# EAGLE design Freq-counter (EAGLE 9.6.2)
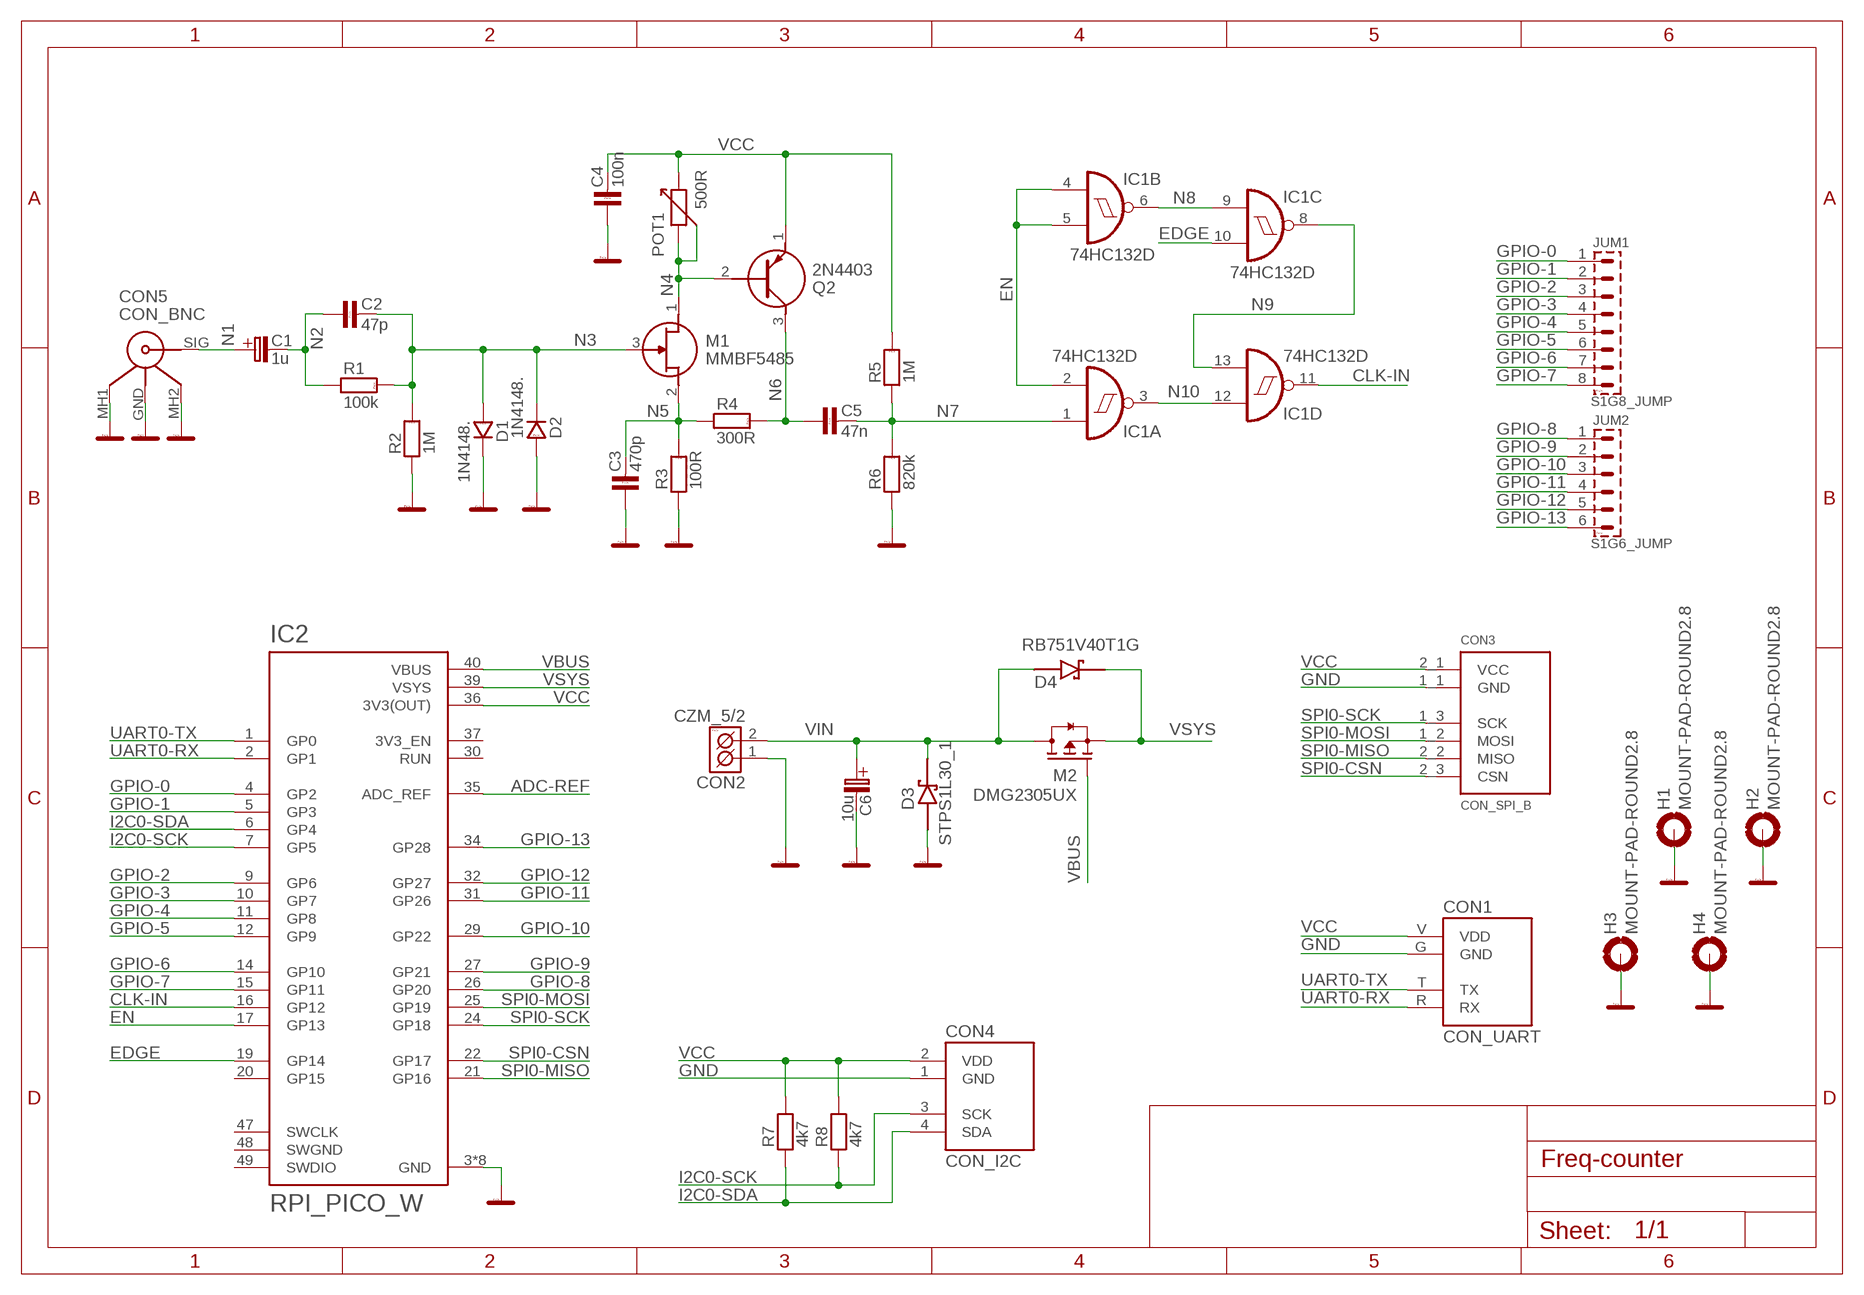
[diagram p0: schematic, sheet 1]

## Parts
C1  1u  C_EL_SMDB  [C_EL-SMD_B]
C2  47p  C-KER_0805  [0805]
C3  470p  C-KER_0805  [0805]
C4  100n  C-KER_0805  [0805]
C5  47n  C-KER_0805  [0805]
C6  10u  C_EL_SMDD  [C_EL-SMD_D]
CON1  CON_UART  [UART_CONN]
CON2  CZM_5/2  [CZM_5/2]
CON3  CON_SPI_B  [SPI_CONN_2]
CON4  CON_I2C  [I2C_CONN]
CON5  CON_BNC  [CPBNCPC010]
D1  1N4148.  [SOD-80]
D2  1N4148.  [SOD-80]
D3  STPS1L30_1  [SMA]
D4  RB751V40T1G  [SOD323]
H1  MOUNT-PAD-ROUND2.8  [2,8-PAD]
H2  MOUNT-PAD-ROUND2.8  [2,8-PAD]
H3  MOUNT-PAD-ROUND2.8  [2,8-PAD]
H4  MOUNT-PAD-ROUND2.8  [2,8-PAD]
IC1  74HC132D  [SO14]
IC2  RPI_PICO_W  RASPBERRY_PICO_W_2  [RPI_PICO_W]
JUM1  S1G8_JUMP  [S1G8_JUM]
JUM2  S1G6_JUMP  [S1G6_JUM]
M1  MMBF5485  [SOT96P237X111-3N]
M2  DMG2305UX  YJL2301D  [TRANSISTOR-FET_SOT23]
POT1  500R  POTENTIOMETER_1  [POT]
Q2  2N4403  [CS_TO-92]
R1  100k  R_0805  [0805]
R2  1M  R_0805  [0805]
R3  100R  R_0805  [0805]
R4  300R  R_0805  [0805]
R5  1M  R_0805  [0805]
R6  820k  R_0805  [0805]
R7  4k7  R_0805  [0805]
R8  4k7  R_0805  [0805]

## Nets
ADC-REF: IC2.35(ADC_REF)
CLK-IN: IC1.11(D:O) IC2.16(GP12)
EDGE: IC1.10(C:I1) IC2.19(GP14)
EN: IC1.2(A:I1) IC1.4(B:I0) IC1.5(B:I1) IC2.17(GP13)
GND: C3.1 C4.1 C6.-(C_EL-) CON1.G(GND) CON2.1(K1) CON3.1_1(GND) CON4.1(GND) CON5.MH1 CON5.MH2 D1.K D2.A D3.2(A) H1.B2,8(MOUNT) H2.B2,8(MOUNT) H3.B2,8(MOUNT) H4.B2,8(MOUNT) IC2.3(GND) IC2.8(GND) IC2.13(GND) IC2.18(GND) IC2.23(GND) IC2.28(GND) IC2.33(GND) IC2.38(GND) R2.1 R3.1 R6.1
GPIO-0: IC2.4(GP2) JUM1.1
GPIO-1: IC2.5(GP3) JUM1.2
GPIO-2: IC2.9(GP6) JUM1.3
GPIO-3: IC2.10(GP7) JUM1.4
GPIO-4: IC2.11(GP8) JUM1.5
GPIO-5: IC2.12(GP9) JUM1.6
GPIO-6: IC2.14(GP10) JUM1.7
GPIO-7: IC2.15(GP11) JUM1.8
GPIO-8: IC2.26(GP20) JUM2.1
GPIO-9: IC2.27(GP21) JUM2.2
GPIO-10: IC2.29(GP22) JUM2.3
GPIO-11: IC2.31(GP26) JUM2.4
GPIO-12: IC2.32(GP27) JUM2.5
GPIO-13: IC2.34(GP28) JUM2.6
I2C0-SCK: CON4.3(SCK) IC2.7(GP5) R8.1
I2C0-SDA: CON4.4(SDA) IC2.6(GP4) R7.1
N1: C1.+(C_EL+) CON5.SIG
N2: C1.-(C_EL-) C2.1 R1.1
N3: C2.2 D1.A D2.K M1.3(G) R1.2 R2.2
N4: M1.1(D) POT1.1 POT1.2 Q2.2(B)
N5: C3.2 M1.2(S) R3.2 R4.1
N6: C5.1 Q2.3(C) R4.2
N7: C5.2 IC1.1(A:I0) R5.1 R6.2
N8: IC1.6(B:O) IC1.9(C:I0)
N9: IC1.8(C:O) IC1.13(D:I1)
N10: IC1.3(A:O) IC1.12(D:I0)
N$1: CON5.GND ; supply symbol labelled GND
SPI0-CSN: CON3.2_3(CSN) IC2.22(GP17)
SPI0-MISO: CON3.2_2(MISO) IC2.21(GP16)
SPI0-MOSI: CON3.1_2(MOSI) IC2.25(GP19)
SPI0-SCK: CON3.1_3(SCK) IC2.24(GP18)
UART0-RX: CON1.R(RX) IC2.2(GP1)
UART0-TX: CON1.T(TX) IC2.1(GP0)
VBUS: IC2.40(VBUS) M2.1(G)
VCC: C4.2 CON1.V(VDD) CON3.2_1(VCC) CON4.2(VDD) IC2.36(3V3(OUT)) POT1.3 Q2.1(E) R5.2 R7.2 R8.2
VIN: C6.+(C_EL+) CON2.2(K2) D3.1(C) D4.2(A) M2.3(D)
VSYS: D4.1(C) IC2.39(VSYS) M2.2(S)
Unconnected: IC2.20(GP15) IC2.30(RUN) IC2.37(3V3_EN) IC2.47(SWCLK) IC2.49(SWDIO)

## Power pins joined to a net without a drawn wire
GND: IC1.7(P:GND)
SWGND: IC2.48(SWGND)
VCC: IC1.14(P:VCC)

## Library data of the parts
C1 C6 = #_NG_knihovna:C_EL_SMD
C2-C5 = #PaJa_31:C-KER: Kondenzator - keramicky
CON1 = #_NG_knihovna:CON_UART
CON2 = #PaJa_konektory:CZM_5/2: Svorkovnice - roztec 5,08mm - dvojita 13,5A/250V
CON3 = #_NG_knihovna:CON_SPI
CON4 = #_NG_knihovna:CON_I2C
CON5 = #_NG_knihovna:CON_BNC: RF Connectors / Coaxial Connectors BNC RA JACK 75 OHM Source: Datasheet <https://www.datasheets360.com/pdf/-7916707900000409672?query=CP-BNCPC-010&pqid=103559711>; DESCRIPTION: RF Connectors / Coaxial Connectors BNC RA JACK 75 OHM; HEIGHT: 15.8mm; MANUFACTURER_NAME: Cinch Connectivity Solutions; MANUFACTURER_PART_NUMBER: CP-BNCPC-010; MOUSER_PART_NUMBER: 530-CPBNCPC-010; MOUSER_PRICE-STOCK: https://www.mouser.co.uk/ProductDetail/AIM-Cambridge-Cinch-Connectivity-Solutions/CP-BNCPC-010?qs=atelM%2FHH1EDYnt71VcRMKg%3D%3D
D1 D2 = #PaJa_31:1N4148: Univerzalni dioda - 0,15A, 75V
D3 = #_NG_knihovna:STPS1L30
D4 = #_NG_knihovna:RB751V40T1G
H1-H4 = holes:MOUNT-PAD-ROUND: MOUNTING PAD, round
IC1 = 74xx-eu:74*132: Quad 2-input NAND schmitt trigger
IC2 = #_NG_knihovna:RASPBERRY_PICO_W_2
JUM1 = #PaJa_konektory:S1G8_JUMP: Radove konektory - koliky - 8x
JUM2 = #PaJa_konektory:S1G6_JUMP: Radove konektory - koliky - 6x
M1 = SamacSys_Parts:MMBF5485: SOT-23 Source: Datasheet <https://www.onsemi.com/pub/Collateral/MMBF5486-D.PDF>; ARROW_PART_NUMBER: MMBF5485; ARROW_PRICE-STOCK: https://www.arrow.com/en/products/mmbf5485/on-semiconductor; DESCRIPTION: SOT-23; HEIGHT: 1.11mm; MANUFACTURER_NAME: onsemi; MANUFACTURER_PART_NUMBER: MMBF5485; MOUSER_PART_NUMBER: 512-MMBF5485; MOUSER_PRICE-STOCK: https://www.mouser.com/Search/Refine.aspx?Keyword=512-MMBF5485
M2 = #_NG_knihovna:YJL2301D
POT1 = #_NG_knihovna:POTENTIOMETER
Q2 = SamacSys_Parts:2N4403: Bipolar Transistors - BJT PNP Gen Pur SS Source: Datasheet <https://www.mouser.com/ds/2/68/2n4402-46341.pdf>; DESCRIPTION: Bipolar Transistors - BJT PNP Gen Pur SS; HEIGHT: mm; MANUFACTURER_NAME: Central Semiconductor; MANUFACTURER_PART_NUMBER: 2N4403; MOUSER_PART_NUMBER: 610-2N4403; MOUSER_PRICE-STOCK: https://www.mouser.com/Search/Refine.aspx?Keyword=610-2N4403
R1-R6 = #PaJa_31:R: Rezistor
R7 R8 = #_NG_knihovna:R: Rezistor

## Net classes
0 default: clearance 0.205 mm

## Board
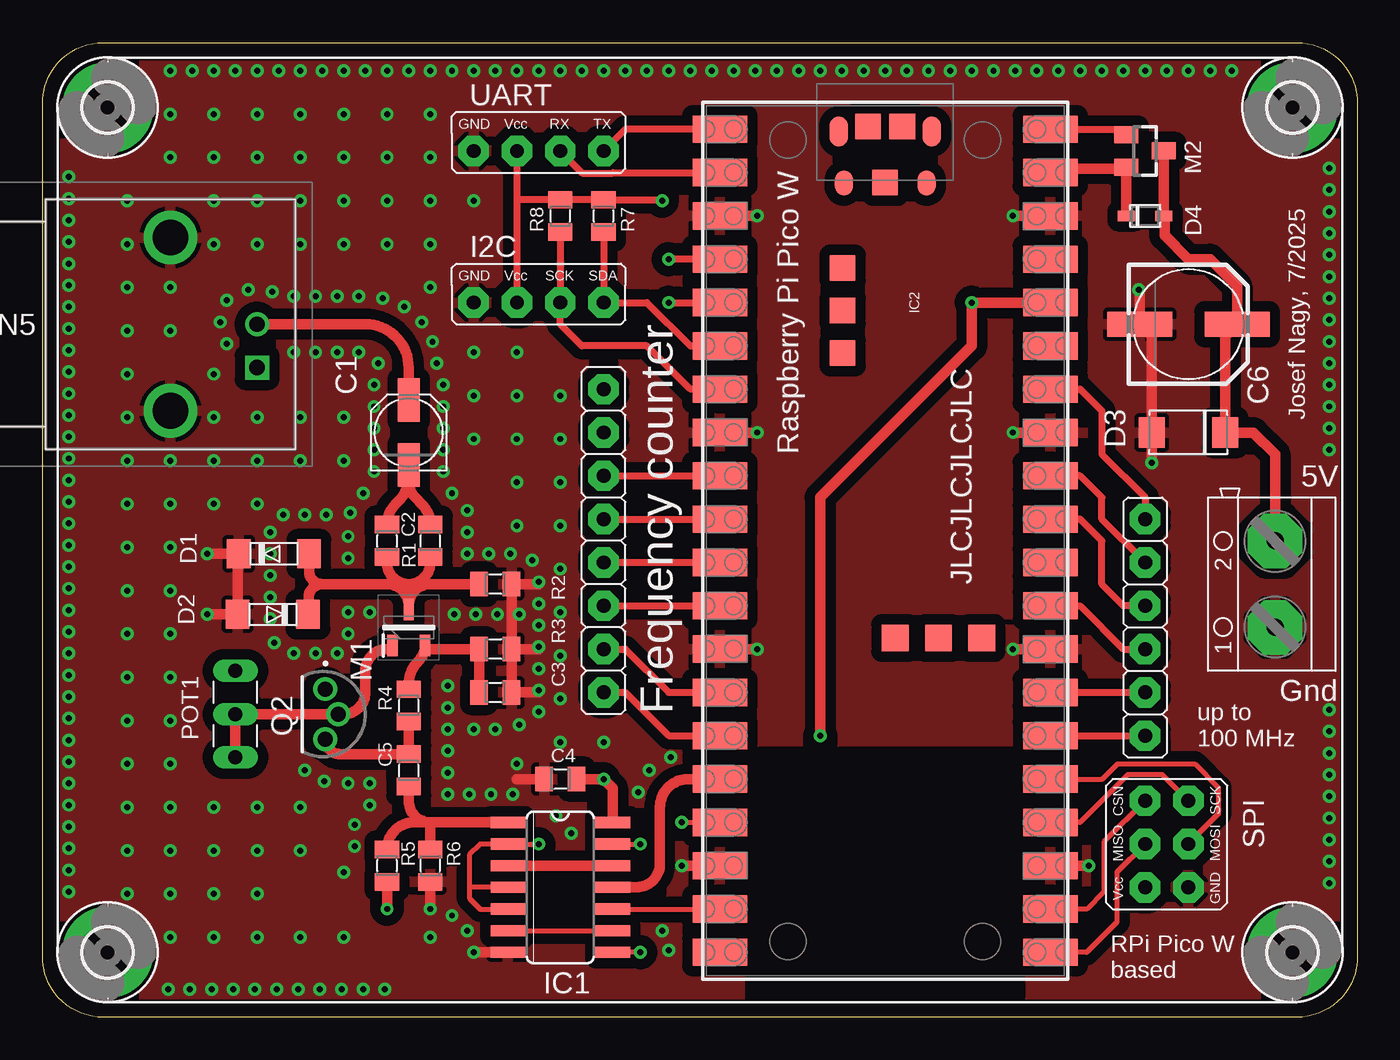
[diagram p1: board, top side]
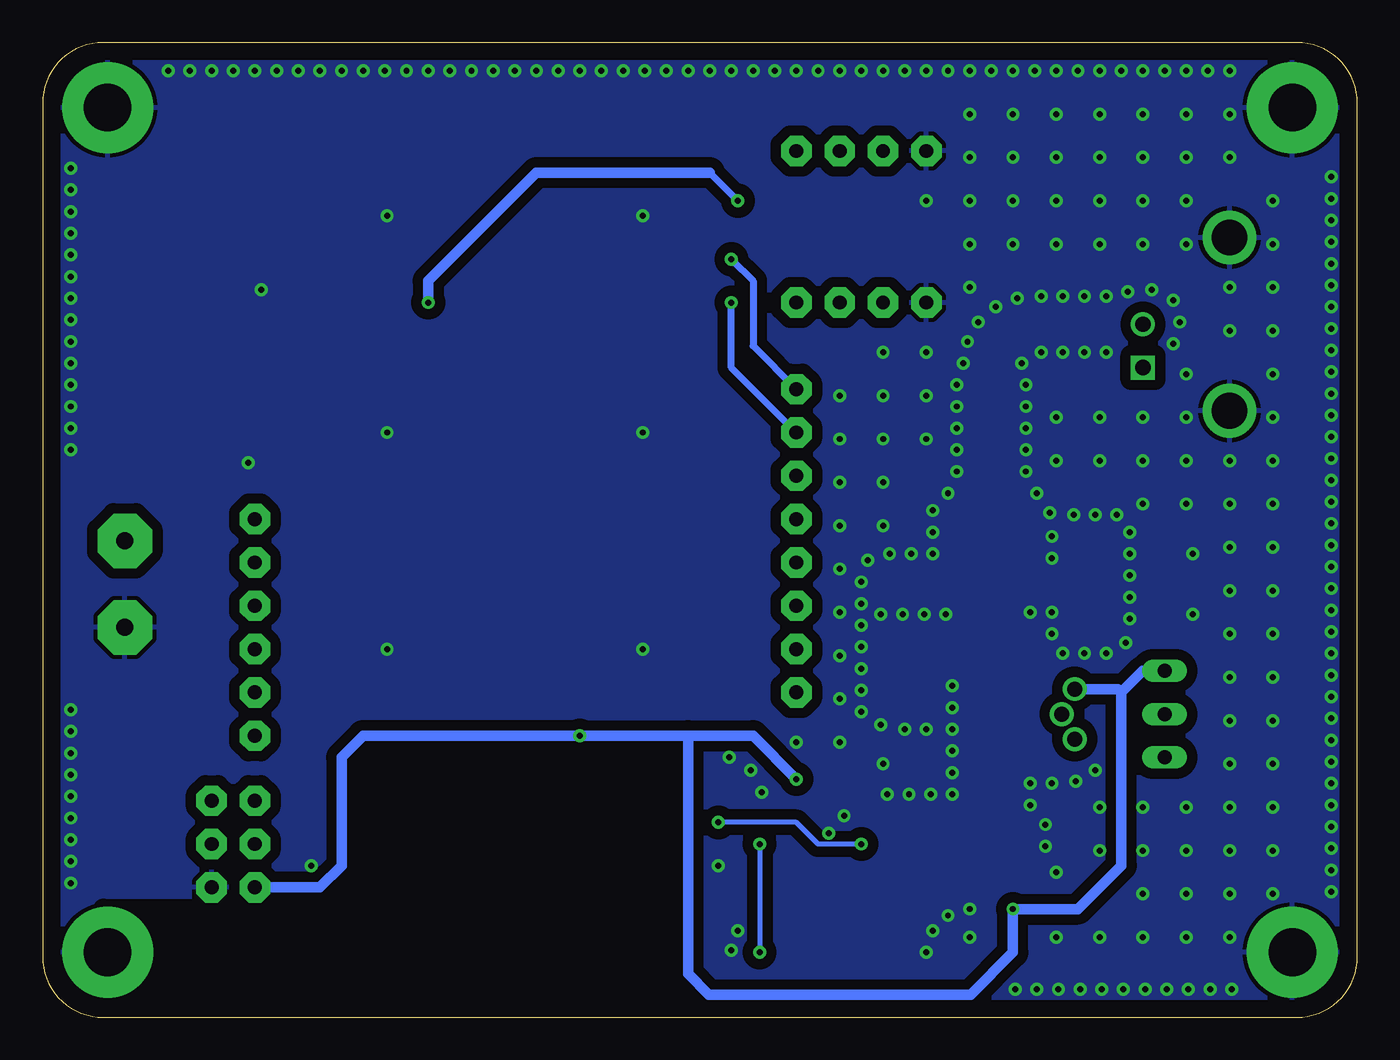
[diagram p2: board, bottom side, seen from below]

Size 77.09 x 57.15 mm. Coordinates in mm from the lower left corner, seen from the top.
Outline: 0,53.59 arc-90 3.56,57.15 73.53,57.15 arc-90 77.09,53.59 77.09,3.56 arc-90 73.53,0 3.56,0 arc-90 0,3.56 0,53.59
Copper layers (1*16): Top 0.035mm / dielectric 1.5mm / Bottom 0.035mm
Design rules "default": minimum track width 6mil, minimum drill 0.35mm, track to track 6mil, track to pad 6mil, pad to pad 6mil, via to via 6mil, smd to smd 6mil, copper to edge 40mil, drill to drill 6mil, minimum pad ring 10mil, minimum via ring 8mil, stop-mask expansion 4mil, vias tented up to drill 0mil, thermal gap 10mil
tRestrict: area 41.8,0 to 57,15.2
bRestrict: area 40.5,0 to 58.3,15.2; area 58.3,0 to 73.5,6.3
vRestrict: area 40.5,0 to 58.3,15.2; area 58.3,0 to 73.5,6.3

### Footprints (pad centres in the part's own frame; a part is rotated, then mirrored left to right if it is on the bottom)
C_EL-SMD_B = smd 2.54 x 1.27: + 1.905,0; - -1.905,0
0805 = smd 1.016 x 1.422: 1 -0.953,0; 2 0.953,0
C_EL-SMD_D = smd 3.81 x 1.473: + 2.857,0; - -2.857,0
UART_CONN = drill 0.813 pad 1.778 octagon: G -3.81,0; R 1.27,0; T 3.81,0; V -1.27,0
CZM_5/2 = drill 1 pad 3.2 octagon: 1 -2.54,0; 2 2.54,0
SPI_CONN_2 = drill 0.813 pad 1.778 octagon: 1_1 -2.54,-1.27; 1_2 0,-1.27; 1_3 2.54,-1.27; 2_1 -2.54,1.27; 2_2 0,1.27; 2_3 2.54,1.27
I2C_CONN = drill 0.813 pad 1.778 octagon: 1 -3.81,0; 2 -1.27,0; 3 1.27,0; 4 3.81,0
CPBNCPC010 = drill 0.9 pad 1.4 square: GND 0,0 | drill 2.1 pad 3.15: MH1 -5.08,-2.54; MH2 -5.08,7.62 | drill 0.9 pad 1.4: SIG 0,2.54
SOD-80 = smd 1.397 x 1.702: A 1.905,0; K -2.223,0
SMA = smd 1.524 x 1.778: 1 -2.159,0; 2 2.159,0
SOD323 = smd 1 x 0.6: 1 -1.1,0; 2 1.1,0
2,8-PAD = drill 2.8 pad 5.334: B2,8 0,0
SO14 = smd 0.66 x 2.032: 1 -3.81,-3.073; 2 -2.54,-3.073; 3 -1.27,-3.073; 4 0,-3.073; 5 1.27,-3.073; 6 2.54,-3.073; 7 3.81,-3.073; 8 3.81,3.073; 9 2.54,3.073; 10 1.27,3.073; 11 0,3.073; 12 -1.27,3.073; 13 -2.54,3.073; 14 -3.81,3.073
RPI_PICO_W = smd 3.2 x 1.6: 1 -9.69,24.13; 2 -9.69,21.59; 3 -9.69,19.05; 4 -9.69,16.51; 5 -9.69,13.97; 6 -9.69,11.43; 7 -9.69,8.89; 8 -9.69,6.35; 9 -9.69,3.81; 10 -9.69,1.27; 11 -9.69,-1.27; 12 -9.69,-3.81; 13 -9.69,-6.35; 14 -9.69,-8.89; 15 -9.69,-11.43; 16 -9.69,-13.97; 17 -9.69,-16.51; 18 -9.69,-19.05; 19 -9.69,-21.59; 20 -9.69,-24.13; 21 9.69,-24.13; 22 9.69,-21.59; 23 9.69,-19.05; 24 9.69,-16.51; 25 9.69,-13.97; 26 9.69,-11.43; 27 9.69,-8.89; 28 9.69,-6.35; 29 9.69,-3.81; 30 9.69,-1.27; 31 9.69,1.27; 32 9.69,3.81; 33 9.69,6.35; 34 9.69,8.89; 35 9.69,11.43; 36 9.69,13.97; 37 9.69,16.51; 38 9.69,19.05; 39 9.69,21.59; 40 9.69,24.13 | smd 1.5 x 1.5: 41 0,21; 42 1,24.3; 43 -1,24.3; 44 -2.5,16; 45 -2.5,13.5; 46 -2.5,11 | smd 1.575 x 1.575: 47 0.584,-5.7; 48 3.124,-5.7; 49 5.664,-5.7 | smd 1.1 x 1.8: A -2.725,24; B 2.725,24 | smd 1.05 x 1.45: C -2.425,20.97; D 2.425,20.97
S1G8_JUM = drill 0.813 pad 1.778 octagon: 1 -8.89,0; 2 -6.35,0; 3 -3.81,0; 4 -1.27,0; 5 1.27,0; 6 3.81,0; 7 6.35,0; 8 8.89,0
S1G6_JUM = drill 0.813 pad 1.778 octagon: 1 -6.35,0; 2 -3.81,0; 3 -1.27,0; 4 1.27,0; 5 3.81,0; 6 6.35,0
SOT96P237X111-3N = smd 1.25 x 0.6: 1 -1.05,0.955; 2 -1.05,-0.955; 3 1.05,0
TRANSISTOR-FET_SOT23 = smd 1 x 1.4: 1 -0.95,-1.1; 2 0.95,-1.1; 3 0,1.1
POT = drill 0.813 long: 1 -2.54,0; 2 0,0; 3 2.54,0
CS_TO-92 = drill 0.88 pad 1.35: 1 -1.47,-2.35 | drill 0.88 pad 1.4: 2 0,-1.6; 3 1.47,-2.35

### Placement (x,y rotation side)
C1  21.46,34.29 90 top
C2  20.19,27.94 270 top
C3  26.54,19.05 180 top
C4  30.35,13.97 0 top
C5  21.46,14.48 270 top
C6  67.18,40.64 0 top
CON1  29.08,50.8 0 top
CON2  72.26,25.4 90 top
CON3  65.91,10.16 90 top
CON4  29.08,41.91 0 top
CON5  12.57,38.1 0 top
D1  13.72,27.18 0 top
D2  13.34,23.62 180 top
D3  67.18,34.29 180 top
D4  64.64,46.99 0 top
H1  3.81,53.34 0 top
H2  3.81,3.81 0 top
H3  73.28,3.81 0 top
H4  73.28,53.34 0 top
IC1  30.35,7.62 270 top
IC2  49.4,27.94 0 top
JUM1  32.89,27.94 270 top
JUM2  64.64,22.86 90 top
M1  21.46,22.86 90 top
M2  64.64,50.8 270 top
POT1  11.3,17.78 90 top
Q2  18.92,17.78 270 top
R1  22.73,27.94 270 top
R2  26.54,25.4 180 top
R3  26.54,21.59 180 top
R4  21.46,18.29 270 top
R5  20.19,8.89 270 top
R6  22.73,8.89 90 top
R7  32.89,46.99 90 top
R8  30.35,46.99 90 top

### Tracks (layer width: path | path; a pad name or v marks a point on that pad's centre or on a via)
CLK-IN
  Top 0.61: IC1.11 34.8,7.62 arc90 36.2,9.02 36.2,12.32 arc-90 37.85,13.97 IC2.16
EDGE
  Top 0.305: IC1.10 IC2.19
EN  (via drill 0.35)
  Top 0.305: 25.02,7.62 25.02,9.53 25.65,10.16 IC1.2 v29.08,10.16 | 25.02,7.62 25.02,6.99 25.65,6.35 IC1.5 | IC1.4 25.02,7.62 | v37.47,11.43 IC2.17
  Bottom 0.305: v29.08,10.16 31.62,10.16 32.89,11.43 v37.47,11.43
GND  (via drill 0.35)
  Top 0.61: 64.64,40.96 C6.- | v9.65,27.18 D1.K 11.43,27.11 D2.A v9.65,23.62 | R6.1 v22.73,6.35 | IC2.3 v41.91,46.99 | IC2.8 v41.91,34.29 | IC2.13 v41.91,21.59 | IC2.18 v37.47,8.89 | IC2.33 v56.9,34.29 | v61.34,8.89 IC2.23 | v56.9,21.59 IC2.28 | v56.9,46.99 IC2.38 | R3.1 C3.1 29.08,19.05 | R3.1 R2.1 29.08,25.4 | R3.1 29.08,21.59 | C4.1 27.81,13.97 | IC1.7 v25.27,3.81 | C6.- 65.02,39.94 D3.2 v65.02,32.51 | C6.- 64.33,42.61 v64.26,42.67
  other vias: 14.73,42.29 16,42.29 17.27,42.29 18.54,42.29 14.73,38.99 16,38.99 17.27,38.99 18.54,38.99 19.69,38.35 19.94,42.16 21.21,41.66 22.23,40.77 22.86,39.62 23.11,38.35 23.5,37.08 23.5,35.81 23.5,34.54 23.5,33.27 23.5,32 24,30.73 19.43,37.08 19.43,35.81 19.43,34.54 19.43,33.27 19.43,32 18.8,30.73 18.03,29.59 17.91,28.19 17.91,26.92 16.64,29.46 15.37,29.46 14.1,29.46 17.91,23.75 19.18,23.75 17.91,22.48 17.27,21.34 16,21.34 14.73,21.34 13.59,21.97 13.34,28.45 13.34,27.18 13.34,25.91 13.34,24.64 13.34,23.37 24.89,29.72 24.89,28.45 24.89,27.18 26.16,27.18 27.43,27.18 28.7,26.8 29.08,25.53 29.08,24.26 29.08,22.99 29.08,21.72 29.08,20.45 29.08,19.18 27.94,23.62 26.67,23.62 25.4,23.62 24.13,23.62 29.08,17.91 27.94,17.14 26.54,16.89 25.27,16.89 23.75,16.89 23.75,18.16 23.75,19.43 23.75,15.62 23.75,14.35 23.75,13.08 25.02,13.08 26.29,13.08 27.56,13.08 30.1,11.81 30.99,10.79 15.37,14.48 16.51,13.84 17.91,13.72 19.18,13.72 19.18,12.45 18.29,11.3 18.29,10.03 24.89,5.08 24,5.97 36.32,5.08 36.7,3.94 34.92,13.21 35.56,14.48 36.83,15.24 13.46,42.55 12.07,42.67 10.8,42.04 10.41,40.77 10.8,39.5 7.49,55.5 10.03,55.5 12.57,55.5 15.11,55.5 8.76,55.5 24,55.5 22.73,55.5 21.46,55.5 20.19,55.5 18.92,55.5 17.65,55.5 16.38,55.5 13.84,55.5 11.3,55.5 69.72,55.5 68.45,55.5 51.94,55.5 53.21,55.5 54.48,55.5 55.75,55.5 57.02,55.5 58.29,55.5 59.56,55.5 60.83,55.5 62.1,55.5 63.37,55.5 64.64,55.5 65.91,55.5 67.18,55.5 32.89,55.5 27.81,55.5 29.08,55.5 30.35,55.5 31.62,55.5 41.78,55.5 43.05,55.5 44.32,55.5 45.59,55.5 46.86,55.5 35.43,55.5 34.16,55.5 36.7,55.5 37.97,55.5 39.24,55.5 40.51,55.5 49.4,55.5 50.67,55.5 48.13,55.5 25.27,55.5 26.54,55.5 7.37,1.65 8.64,1.65 20.07,1.65 16.26,1.65 17.53,1.65 18.8,1.65 9.91,1.65 11.18,1.65 12.45,1.65 13.72,1.65 14.99,1.65 75.44,49.78 75.44,37.08 75.44,43.43 75.44,45.97 75.44,44.7 75.44,48.51 75.44,47.24 75.44,40.89 75.44,42.16 75.44,39.62 75.44,38.35 75.44,35.81 75.44,34.54 75.44,33.27 75.44,7.87 75.44,9.14 75.44,18.03 75.44,16.76 75.44,15.49 75.44,14.22 75.44,12.95 75.44,11.68 75.44,10.41 1.52,7.37 1.52,8.64 1.52,13.72 1.52,12.45 1.52,11.18 1.52,9.91 1.52,31.5 1.52,30.23 1.52,42.93 1.52,40.39 1.52,39.12 1.52,37.85 1.52,41.66 1.52,36.58 1.52,35.31 1.52,34.04 1.52,32.77 1.52,20.07 1.52,21.34 1.52,22.61 1.52,23.88 1.52,25.15 1.52,26.42 1.52,27.69 1.52,28.96 1.52,18.8 1.52,17.53 1.52,16.26 1.52,14.99 1.52,49.28 1.52,48.01 1.52,46.74 1.52,45.47 1.52,44.2 22.73,52.96 22.73,50.42 22.73,47.88 25.27,47.88 20.19,50.42 20.19,47.88 20.19,45.34 22.73,45.34 17.65,47.88 17.65,45.34 22.73,42.8 25.27,38.99 15.11,45.34 15.11,47.88 12.57,47.88 10.03,47.88 4.95,47.88 12.57,45.34 10.03,45.34 7.49,42.8 4.95,42.8 4.95,45.34 7.49,50.42 7.49,52.96 4.95,40.26 4.95,37.72 4.95,35.18 4.95,32.64 7.49,32.64 10.03,32.64 10.03,35.18 10.03,37.72 7.49,40.26 12.57,32.64 15.11,32.64 15.11,35.18 17.65,35.18 17.65,32.64 12.57,35.18 12.57,30.1 10.03,30.1 7.49,30.1 25.27,36.45 25.27,33.91 27.81,36.45 30.35,36.45 27.81,38.99 27.81,33.91 27.81,31.37 30.35,31.37 30.35,33.91 30.35,28.83 27.81,28.83 7.49,27.56 7.49,25.02 7.49,22.48 7.49,19.94 7.49,14.86 7.49,12.32 7.49,9.78 7.49,7.24 7.49,4.7 30.35,26.29 30.35,23.75 30.35,21.21 30.35,18.67 30.35,16.13 27.81,14.86 32.89,16.13 4.95,30.1 4.95,27.56 4.95,25.02 4.95,22.48 10.03,52.96 12.57,52.96 12.57,50.42 15.11,50.42 15.11,52.96 10.03,50.42 17.65,50.42 17.65,52.96 20.19,52.96 7.49,17.4 4.95,19.94 4.95,14.86 4.95,17.4 10.03,7.24 10.03,9.78 10.03,12.32 12.57,12.32 12.57,9.78 15.11,9.78 15.11,12.32 12.57,7.24 12.57,4.7 10.03,4.7 4.95,7.24 4.95,12.32 4.95,9.78 15.11,4.7 17.65,4.7 17.65,8.51 22.73,4.7
  pour Bottom (isolate 0.61): -0.13,57.15 77.34,57.15 77.34,0 -0.13,0
  pour Top (isolate 0.61): -0.13,57.15 77.34,57.15 77.34,0 -0.13,0
GPIO-0  (via drill 0.35)
  Top 0.406: IC2.4 v36.7,44.45
  Bottom 0.406: v36.7,44.45 35.43,43.18 35.43,39.37 JUM1.1
GPIO-1  (via drill 0.35)
  Top 0.406: v36.7,41.91 IC2.5
  Bottom 0.406: JUM1.2 36.7,38.1 v36.7,41.91
GPIO-2
  Top 0.406: JUM1.3 IC2.9
GPIO-3
  Top 0.406: JUM1.4 IC2.10
GPIO-4
  Top 0.406: JUM1.5 IC2.11
GPIO-5
  Top 0.406: JUM1.6 IC2.12
GPIO-6
  Top 0.406: JUM1.7 34.16,21.59 36.7,19.05 IC2.14
GPIO-7
  Top 0.406: JUM1.8 34.16,19.05 36.7,16.51 IC2.15
GPIO-8
  Top 0.406: IC2.26 JUM2.1
GPIO-9
  Top 0.406: IC2.27 JUM2.2
GPIO-10
  Top 0.406: IC2.29 60.83,24.13 63.37,21.59 JUM2.3
GPIO-11
  Top 0.406: JUM2.4 63.37,24.13 62.1,25.4 62.1,27.94 60.83,29.21 IC2.31
GPIO-12
  Top 0.406: IC2.32 60.83,31.75 62.1,30.48 62.1,29.21 JUM2.5
GPIO-13
  Top 0.406: IC2.34 60.83,36.83 62.1,35.56 62.1,33.02 64.64,30.48 JUM2.6
I2C0-SCK
  Top 0.406: R8.1 CON4.3 30.35,40.64 31.62,39.37 35.43,39.37 37.97,36.83 IC2.7
I2C0-SDA
  Top 0.406: R7.1 CON4.4 35.43,41.91 37.97,39.37 IC2.6
N1
  Top 0.61: C1.+ 21.46,38.1 arc90 18.92,40.64 CON5.SIG
N2
  Top 0.61: C2.1 arc-45 20.69,30.09 20.87,30.26 arc45 21.46,31.71 C1.- 21.46,31.43 arc45 21.86,30.46 22.24,30.09 arc-45 R1.1
N3
  Top 0.61: C2.2 20.19,26.67 arc90 21.46,25.4 | 21.46,25.4 arc90 22.73,26.67 R1.2 | 21.46,25.4 M1.3 21.46,24.13 | R2.2 22.73,25.4 | 22.73,25.4 21.46,25.4 | D2.K 15.59,23.65 | 15.59,23.65 15.62,23.69 | 21.46,25.4 20.19,25.4 | 20.19,25.4 16.38,25.4 | 16.38,25.4 arc90 15.59,24.61 15.59,23.65 | 16.38,25.4 arc-90 15.62,26.16 D1.A | 21.46,24.13 arc-90 22.73,25.4 | 21.46,24.13 arc90 20.19,25.4
N4
  Top 0.61: M1.1 arc-90 20.29,21.59 20.19,21.59 arc90 18.92,20.32 18.92,19.05 arc-90 17.65,17.78 Q2.2 POT1.2 POT1.1
N5
  Top 0.61: C3.2 R3.2 22.42,21.59 M1.2 arc-45 22.04,20.9 arc45 21.46,19.5 R4.1
N6
  Top 0.61: R4.2 C5.1 17.45,15.43 arc-90 Q2.3
N7
  Top 0.61: C5.2 21.46,12.7 arc90 22.73,11.43 | 22.73,11.43 25.27,11.43 IC1.1 | R6.2 22.73,11.43 | R5.1 arc-90 21.78,11.43 22.73,11.43
N8
  Top 0.305: IC1.6 IC1.9
N9  (via drill 0.35)
  Top 0.305: IC1.13 v35.05,10.16 | v35.05,3.81 IC1.8
  Bottom 0.305: v35.05,10.16 v35.05,3.81
N10
  Top 0.61: IC1.3 IC1.12
SPI0-CSN
  Top 0.305: CON3.2_3 62.23,10.29 62.23,7.37 61.21,6.35 IC2.22
SPI0-MISO
  Top 0.305: IC2.21 61.21,3.81 62.99,5.59 62.99,7.66 62.99,8.51 CON3.2_2
SPI0-MOSI
  Top 0.305: IC2.25 62.14,13.97 63.03,14.86 67.55,14.86 68.94,13.47 68.94,11.93 67.18,10.18 CON3.1_2
SPI0-SCK
  Top 0.305: CON3.1_3 67.17,12.7 65.64,14.22 63.63,14.22 60.83,11.43 IC2.24
UART0-RX
  Top 0.406: IC2.2 33.46,49.53 33.43,49.5 31.65,49.5 CON1.R
UART0-TX
  Top 0.406: IC2.1 34.16,52.07 CON1.T
VBUS
  Top 0.406: IC2.40 63.22,52.07 M2.1
VCC  (via drill 0.35)
  Top 0.406: CON1.V 27.81,48.01 | 27.81,48.01 CON4.2 | 27.81,48.01 27.88,47.94 R8.2 R7.2 36.26,47.94 v36.32,47.88
  Top 0.61: IC2.36 v54.48,41.91 54.48,39.37 45.59,30.48 v45.59,16.51 | v20.19,6.35 R5.2 | C4.2 v32.89,13.97 33.43,13.44 IC1.14
  Bottom 0.406: v36.32,47.88 37.97,49.53
  Bottom 0.61: 37.97,49.53 48.13,49.53 54.48,43.18 v54.48,41.91 | v32.89,13.97 35.43,16.51 39.24,16.51 | 39.24,16.51 v45.59,16.51 58.29,16.51 59.56,15.24 59.56,8.89 60.83,7.62 CON3.2_1 | 13.84,19.05 13.84,8.89 16.38,6.35 v20.19,6.35 20.19,3.81 22.67,1.33 38.04,1.33 39.24,2.54 39.24,16.51 | 13.84,19.05 12.57,20.32 POT1.3 | 13.84,19.05 14.04,19.25 Q2.1
VIN
  Top 0.61: M2.3 D4.2 65.79,46.95 65.79,45.85 67.18,44.45 68.45,44.45 70.04,42.86 C6.+ 69.34,39.94 D3.1 70.99,34.29 72.26,33.02 CON2.2
VSYS
  Top 0.406: IC2.39 59.33,49.77 59.41,49.85
  Top 0.61: 59.33,49.77 63.46,49.77 M2.2 D4.1

### Text on the board
tPlace: UART | I2C | Josef Nagy, 7/2025 | Raspberry Pi Pico W | 5V | Gnd | Frequency counter | up to / 100 MHz | SPI | RPi Pico W / based
tNames: JLCJLCJLCJLC